# Altium project ezlo-thermostat.PrjPcb (part 3 of 3)

## Sheet ESP32-Sheet.SchDoc: =Projectname
size A4; SheetNumber: 8; SheetTotal: 9
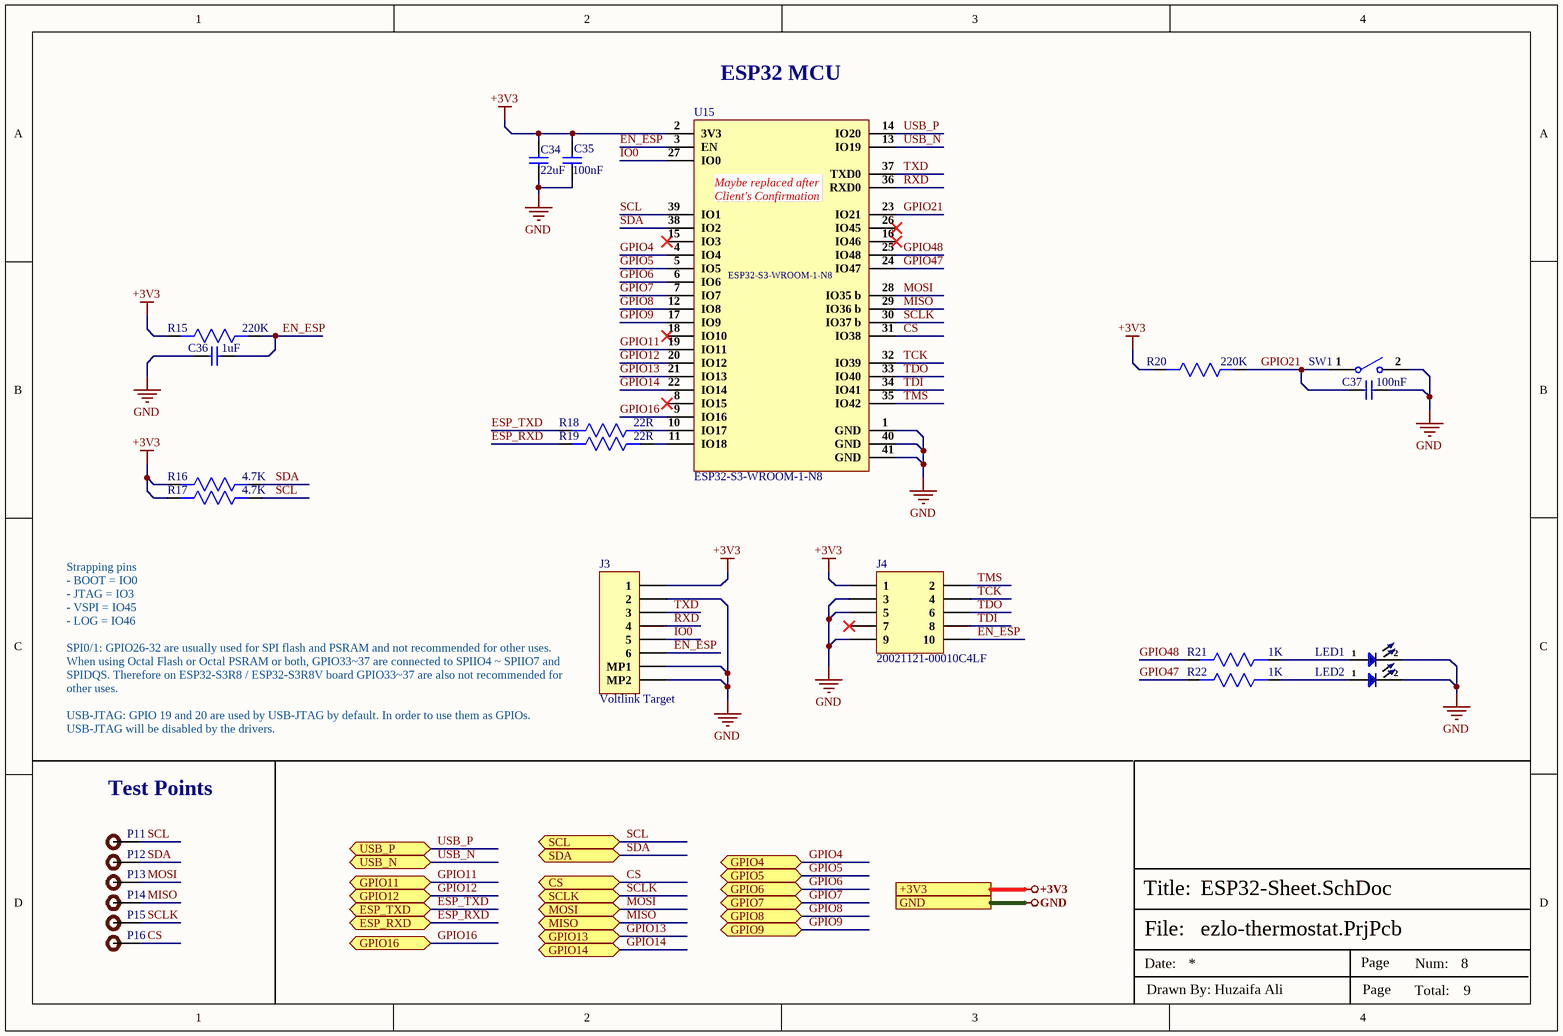
[diagram p7: ESP32-Sheet.SchDoc]

### Parts
C34  22uF  [Cap-0603]
C35  100nF  [Cap-0402]
C36  1uF  [Cap-0402]
C37  100nF  [Cap-0402]
J3  Voltlink Target  [Voltlink Target]
J4  20021121-00010C4LF  [20021121-00010C4LF_]
LED1  Transparent  [LED-0603]  (value not drawn)
LED2  Yellow  [LED-0603]  (value not drawn)
P11  TEST POINT  [Test-point]  (value not drawn)
P12  TEST POINT  [Test-point]  (value not drawn)
P13  TEST POINT  [Test-point]  (value not drawn)
P14  TEST POINT  [Test-point]  (value not drawn)
P15  TEST POINT  [Test-point]  (value not drawn)
P16  TEST POINT  [Test-point]  (value not drawn)
R15  220K  [Res-0402]
R16  4.7K  [Res-0402]
R17  4.7K  [Res-0402]
R18  22R  [Res-0402]
R19  22R  [Res-0402]
R20  220K  [Res-0402]
R21  1K  [Res-0402]
R22  1K  [Res-0402]
SW1  YTS-B003-2A  [YTS-B003-2A]  (value not drawn)
U15  ESP32-S3-WROOM-1-N8  [41-SMD Module]

### Ports
+3V3, CS (bidir), ESP_RXD (bidir), ESP_TXD (bidir), GND, GPIO4 (bidir), GPIO5 (bidir), GPIO6 (bidir), GPIO7 (bidir), GPIO8 (bidir), GPIO9 (bidir), GPIO11 (bidir), GPIO12 (bidir), GPIO13 (bidir), GPIO14 (bidir), GPIO16 (bidir), MISO (bidir), MOSI (bidir), SCL (bidir), SCLK (bidir), SDA (bidir), USB_N (bidir), USB_P (bidir)

### Nets
+3V3: C34.1 C35.1 J3.1 J4.1 R15.2 R16.2 R17.2 R20.2 U15.2(3V3) ; port +3V3
GND: C34.2 C35.2 C36.1 C37.2 J3.2 J3.MP1 J3.MP2 J4.3 J4.5 J4.9 LED1.2 LED2.2 SW1.2(NO) U15.1(GND) U15.40(GND) U15.41(GND) ; port GND
CS: P16.1 U15.31(IO38) ; port CS  [project net B1]
EN_ESP: C36.2 J3.6 J4.10 R15.1 U15.3(EN)
ESP_RXD: R19.2 ; port ESP_RXD
ESP_TXD: R18.2 ; port ESP_TXD
GPIO4: U15.4(IO4) ; port GPIO4
GPIO5: U15.5(IO5) ; port GPIO5
GPIO6: U15.6(IO6) ; port GPIO6
GPIO7: U15.7(IO7) ; port GPIO7
GPIO8: U15.12(IO8) ; port GPIO8
GPIO9: U15.17(IO9) ; port GPIO9
GPIO11: U15.19(IO11) ; port GPIO11
GPIO12: U15.20(IO12) ; port GPIO12
GPIO13: U15.21(IO13) ; port GPIO13  [project net B5]
GPIO14: U15.22(IO14) ; port GPIO14  [project net B6]
GPIO16: U15.9(IO16) ; port GPIO16
GPIO21: C37.1 R20.1 SW1.1(COMMON) U15.23(IO21)
GPIO47: R22.2 U15.24(IO47)
GPIO48: R21.2 U15.25(IO48)
IO0: J3.5 U15.27(IO0)
MISO: P14.1 U15.29(IO36_b) ; port MISO  [project net B4]
MOSI: P13.1 U15.28(IO35_b) ; port MOSI  [project net B3]
RXD: J3.4 U15.36(RXD0)
SCL: P11.1 R17.1 U15.39(IO1) ; port SCL
SCLK: P15.1 U15.30(IO37_b) ; port SCLK  [project net B2]
SDA: P12.1 R16.1 U15.38(IO2) ; port SDA
TCK: J4.4 U15.32(IO39)
TDI: J4.8 U15.34(IO41)
TDO: J4.6 U15.33(IO40)
TMS: J4.2 U15.35(IO42)
TXD: J3.3 U15.37(TXD0)
USB_N: U15.13(IO19) ; port USB_N
USB_P: U15.14(IO20) ; port USB_P
NetLED1_1: LED1.1 R21.1
NetLED2_1: LED2.1 R22.1
NetR18_1: R18.1 U15.10(IO17)
NetR19_1: R19.1 U15.11(IO18)

Not connected (* = marked no-connect by the designer): J4 7*; U15 8(IO15)* 15(IO3)* 16(IO46)* 18(IO10)* 26(IO45)*

### Notes on the sheet
- (near U15) ESP32 MCU
- (near U15) Maybe replaced after Client's Confirmation
- Strapping pins
  - BOOT = IO0
  - JTAG = IO3
  - VSPI = IO45
  - LOG = IO46
  SPI0/1: GPIO26-32 are usually used for SPI flash and PSRAM and not recommended for other uses.
  When using Octal Flash or Octal PSRAM or both, GPIO33~37 are connected to SPIIO4 ~ SPIIO7 and SPIDQS. Therefore on ESP32-S3R8 / ESP32-S3R8V board GPIO33~37 are also not recommended for other uses.
  USB-JTAG: GPIO 19 and 20 are used by USB-JTAG by default. In order to use them as GPIOs. USB-JTAG will be disabled by the drivers.
- Test Points
- File:
- Title:
- Date:
- Page
- Num:
- Total:
- Drawn By: Huzaifa Ali

### Library data of the parts
C34 = CC0603MRX5R5BB226: CAP CER 22UF 6.3V X5R 0603; Manufacturer: Yageo; Tolerance: 20%; Supplier 1: Mouser; Manufacturer Part Number: CC0603MRX5R5BB226; RoHS: Yes; Category: Ceramic Capacitors; Stock 1: 3030; Pricing 1: 1=0.33000, 10=0.22500, 50=0.22500, 100=0.12800, 1000=0.07900, 10000=0.06500 (USD); Mount: Surface Mount; Case/Package: 0603; Case Code (Metric): 1608; Case Code (Imperial): 0603; Weight: 7.1E-05oz; Min Operating Temperature: -55°C; Max Operating Temperature: 85°C; Capacitance: 22uF; Packaging: Tape and Reel; Dielectric: X5R; Voltage Rating: 6.3V; Termination: SMD/SMT; Resistor Type: Ceramic; Voltage Rating (DC): 6.3V; Package Quantity: 4000; Length: 0.063inch; Width: 0.031inch; Thickness: 0.035inch; Depth: 0.8mm; Lead Free: Lead Free; Halogen Free: Halogen Free; RoHS Compliant: Yes; ComponentLink1URL: http://www.mouser.com/ds/2/447/Yageo_UPY-GP_NP0_16V-to-50V_9-358835.pdf?src-supplier=Mouser; ComponentLink1Description: http://www.mouser.com/ds/2/447/Yageo_UPY-GP_NP0_16V-to-50V_9-358835.pdf?src-supplier=Mouser; ComponentLink2URL: http://www.yageo.com/documents/recent/UPY-GPHC_X5R_4V-to-50V_25.pdf?src-supplier=Digi-Key; ComponentLink2Description: http://www.yageo.com/documents/recent/UPY-GPHC_X5R_4V-to-50V_25.pdf?src-supplier=Digi-Key; Supplier Part Number 1: 603-CC603MRX5R5BB226; LCSC Part Number: C109448
C35 C37 = CC0402KRX5R8BB104: CAP CER 0.1UF 25V X5R 0402; Manufacturer: Yageo; Tolerance: 10%; Item Type: Capacitor; Supplier 1: Digi-Key; Manufacturer Part Number: CC0402KRX5R8BB104; RoHS: Yes; Category: Ceramic Capacitors; Stock 1: 4598218; Pricing 1: 1=0.10000, 10=0.03800, 50=0.02100, 100=0.01710, 500=0.01224, 1000=0.00961, 2500=0.00874, 5000=0.00804 (USD); Mount: Surface Mount; Case/Package: 0402; Case Code (Metric): 1005; Case Code (Imperial): 0402; Min Operating Temperature: -55°C; Max Operating Temperature: 85°C; Voltage Rating: 25V; Packaging: Tape and Reel; Capacitance: 100nF; Voltage Rating (DC): 25V; Dielectric: X5R; Resistor Type: Ceramic; Series: CC; Length: 0.039inch; Width: 0.02inch; Thickness: 0.022inch; Depth: 0.5mm; Lead Free: Lead Free; Halogen Free: Halogen Free; RoHS Compliant: Yes; ComponentLink1URL: http://www.mouser.com/ds/2/447/UPY-GPHC_X5R_4V-to-50V_25-1131599.pdf?src-supplier=Mouser; ComponentLink1Description: http://www.mouser.com/ds/2/447/UPY-GPHC_X5R_4V-to-50V_25-1131599.pdf?src-supplier=Mouser; ComponentLink2URL: http://www.yageo.com/documents/recent/UPY-GPHC_X5R_4V-to-50V-16.pdf?src-supplier=Future+Electronics; ComponentLink2Description: http://www.yageo.com/documents/recent/UPY-GPHC_X5R_4V-to-50V-16.pdf?src-supplier=Future+Electronics; ComponentLink3URL: http://www.yageo.com/documents/recent/UPY-GPHC_X5R_4V-to-50V_25.pdf?src-supplier=Digi-Key; ComponentLink3Description: http://www.yageo.com/documents/recent/UPY-GPHC_X5R_4V-to-50V_25.pdf?src-supplier=Digi-Key; Supplier Part Number 1: 311-1697-1-ND; LCSC Part Number: C106256
C36 = CC0402KRX5R8BB105: CAP CER 1UF 25V X5R 0402; Manufacturer: Yageo; Tolerance: 10%; Supplier 1: Mouser; Manufacturer Part Number: CC0402KRX5R8BB105; RoHS: Yes; Category: Ceramic Capacitors; Stock 1: 91975; Pricing 1: 1=0.30000, 10=0.20400, 50=0.20400, 100=0.11600, 1000=0.07200, 10000=0.05900 (USD); Mount: Surface Mount; Case/Package: 0402; Case Code (Metric): 1005; Case Code (Imperial): 0402; Weight: 2.3E-05oz; Min Operating Temperature: -55°C; Max Operating Temperature: 85°C; Packaging: Tape and Reel; Capacitance: 1uF; Voltage Rating: 25V; Dielectric: X5R; Termination: SMD/SMT; Voltage Rating (DC): 25V; Package Quantity: 10000; Length: 0.039inch; Width: 0.02inch; Thickness: 0.022inch; Lead Free: Lead Free; Halogen Free: Halogen Free; RoHS Compliant: Yes; ComponentLink1URL: http://www.mouser.com/ds/2/447/Yageo_UPY-GP_NP0_16V-to-50V_9-358835.pdf?src-supplier=Mouser; ComponentLink1Description: http://www.mouser.com/ds/2/447/Yageo_UPY-GP_NP0_16V-to-50V_9-358835.pdf?src-supplier=Mouser; ComponentLink2URL: http://www.yageo.com/documents/recent/UPY-GPHC_X5R_4V-to-50V_25.pdf?src-supplier=Digi-Key; ComponentLink2Description: http://www.yageo.com/documents/recent/UPY-GPHC_X5R_4V-to-50V_25.pdf?src-supplier=Digi-Key; ComponentLink3URL: https://4donline.ihs.com/images/VipMasterIC/IC/YAGO/YAGO-S-A0006851646/YAGO-S-A0006851646-1.pdf?hkey=6D3A4C79FDBF58556ACFDE234799DDF0&src-supplier=Newark; ComponentLink3Description: https://4donline.ihs.com/images/VipMasterIC/IC/YAGO/YAGO-S-A0006851646/YAGO-S-A0006851646-1.pdf?hkey=6D3A4C79FDBF58556ACFDE234799DDF0&src-supplier=Newark; Supplier Part Number 1: 603-CC402KRX5R8BB105; LCSC Part Number: C326568
J3 = C145963: 1x6P SH 1 1mm 6 SMD,P=1mm Wire To Board / Wire To Wire Connector ROHS; Manufacturer: BOOMELE; Manufacturer Part Number: C145963; Package: SMD,P=1mm; LCSC Part Number: C145963; Item Type: Connector; ComponentLink1Description: LCSC; ComponentLink1URL: https://www.lcsc.com/product-detail/Wire-To-Board-Wire-To-Wire-Connector_BOOMELE-Boom-Precision-Elec-C145963_C145963.html
J4 = 20021121-00010C4LF: CONN HEADER SMD 10POS 1.27MM; Manufacturer: Amphenol FCI; Number of Contacts: 10; Contact Resistance: 30mR; Current Rating: 1A; Voltage Rating: 125V; Insulation Resistance: 100MR; Gender: Male; Connector Type: Male Pin,Header; Row Spacing: 0.05inch; Stack Height: 3mm; Item Type: Jtag Header; Supplier 1: Digi-Key; Manufacturer Part Number: 20021121-00010C4LF; Stock 1: 0; Pricing 1: 1=0.87, 10=0.761, 100=0.6563 (USD); Mount: Surface Mount; Contact Plating: Gold; Contact Material: Copper Alloy,Copper,Gold; Color: Black; Housing Color: Black; Housing Material: Thermoplastic; Min Operating Temperature: -40°C; Max Operating Temperature: 85°C; Number of Rows: 2; Termination: Solder; Packaging: Tape and Reel; Package Quantity: 600; Number of Positions: 10; Max Voltage Rating (AC): 125V; Orientation: Straight; Length: 6.35mm; Pitch: 1.27mm; Contact Mating Length: 0.12inch; Depth: 3.4mm; Radiation Hardening: No; REACH SVHC: No SVHC; ComponentLink1URL: https://www.verical.com/server-webapp/html/getDatasheet?partID=177140&src-supplier=Verical; ComponentLink1Description: https://www.verical.com/server-webapp/html/getDatasheet?partID=177140&src-supplier=Verical; ComponentLink2URL: http://portal.fciconnect.com/Comergent/fci/drawing/20021121.pdf?src-supplier=Avnet; ComponentLink2Description: http://portal.fciconnect.com/Comergent/fci/drawing/20021121.pdf?src-supplier=Avnet; ComponentLink3URL: https://cdn.amphenol-icc.com/media/wysiwyg/files/drawing/20021121.pdf?src-supplier=Digi-Key; ComponentLink3Description: https://cdn.amphenol-icc.com/media/wysiwyg/files/drawing/20021121.pdf?src-supplier=Digi-Key; ComponentLink4URL: http://portal.fciconnect.com/Comergent/fci/drawing/20021121.pdf?src-supplier=Avnet+Europe; ComponentLink4Description: http://portal.fciconnect.com/Comergent/fci/drawing/20021121.pdf?src-supplier=Avnet+Europe; ComponentLink5URL: https://media.digikey.com/pdf/Data%20Sheets/FCI%20PDFs/Minitek%20127_Catalog.pdf?src-supplier=Digi-Key; ComponentLink5Description: https://media.digikey.com/pdf/Data%20Sheets/FCI%20PDFs/Minitek%20127_Catalog.pdf?src-supplier=Digi-Key; ComponentLink6URL: http://portal.fciconnect.com/Comergent//fci/drawing/20021121.pdf?src-supplier=Mouser; ComponentLink6Description: http://portal.fciconnect.com/Comergent//fci/drawing/20021121.pdf?src-supplier=Mouser; Supplier Part Number 1: 609-3695-6-ND; LCSC Part Number: C150517
LED1 = 19-21/R7C-AK1L2BY/3T: Red 632nm LED Indication - Discrete 2.05V 0603 (1608 Metric); Manufacturer: Everlight Elec; Manufacturer Part Number: 19-21/R7C-AK1L2BY/3T; Package: 0603; LCSC Part Number: C1322287; Item Type: LED; ComponentLink1Description: LCSC; ComponentLink1URL: https://www.lcsc.com/product-detail/Light-Emitting-Diodes-LED_Everlight-Elec-19-21-R7C-AK1L2BY-3T_C1322287.html
LED2 = 19-21/G6C-FM1N2B/3T: Yellow-Green 572nm LED Indication - Discrete 2.05V 0603 (1608 Metric); Manufacturer: Everlight Elec; Manufacturer Part Number: 19-21/G6C-FM1N2B/3T; Package: 0603; LCSC Part Number: C93689; Item Type: LED; ComponentLink1Description: LCSC; ComponentLink1URL: https://www.lcsc.com/product-detail/Light-Emitting-Diodes-LED_Everlight-Elec-19-21-G6C-FM1N2B-3T_C93689.html
P11-P16 = TEST POINT: Test Point ON
R15 R20 = RC0402FR-07220KL: RES 220K OHM 1% 1/16W 0402; Manufacturer: Yageo; Resistance: 220kR; Power Rating: 62.5mW; Voltage Rating: 50V; Temperature Coefficient: 100ppm/°C; Max Power Dissipation: 63mW; Supplier 1: Digi-Key; Manufacturer Part Number: RC0402FR-07220KL; RoHS: Yes; Category: Chip SMD Resistors; Stock 1: 1192792; Pricing 1: 1=0.10000, 10=0.01400, 100=0.00580, 1000=0.00262, 2500=0.00228, 5000=0.00188 (USD); Case/Package: 0402; Case Code (Imperial): 0402; Case Code (Metric): 1005; Weight: 2.3E-05oz; Size Code: 0402; Min Operating Temperature: -55°C; Max Operating Temperature: 155°C; Tolerance: 1%; Package Quantity: 1; Packaging: Tape and Reel; Termination: SMD/SMT; Resistor Type: Thick Film; Number of Terminations: 2; Features: Moisture Resistant; Series: RC; Resistance Tolerance: 1%; Technology: THICK FILM; Construction: Rectangular; Length: 1mm; Width: 0.02inch; Height: 0.016inch; Depth: 0.5mm; RoHS Compliant: Yes; Reach SVHC Compliant: Yes; Military Standard: Not; Lead Free: Lead Free; ComponentLink1URL: https://datasheet.ciiva.com/11808/0900766b80c66297-11808792.pdf?src-supplier=RSComponents; ComponentLink1Description: https://datasheet.ciiva.com/11808/0900766b80c66297-11808792.pdf?src-supplier=RSComponents; ComponentLink2URL: https://datasheet.ciiva.com/5924/1018594-5924944.pdf?src-supplier=Farnell; ComponentLink2Description: https://datasheet.ciiva.com/5924/1018594-5924944.pdf?src-supplier=Farnell; ComponentLink3URL: https://datasheet.ciiva.com/2453/pyu-r-int-thick-7-2453533.pdf?src-supplier=Digi-Key; ComponentLink3Description: https://datasheet.ciiva.com/2453/pyu-r-int-thick-7-2453533.pdf?src-supplier=Digi-Key; ComponentLink4URL: https://datasheet.ciiva.com/2453/pyu-r-int-thick-7-2453534.pdf?src-supplier=Digi-Key; ComponentLink4Description: https://datasheet.ciiva.com/2453/pyu-r-int-thick-7-2453534.pdf?src-supplier=Digi-Key; ComponentLink5URL: https://datasheet.ciiva.com/2453/pyu-r-int-thick-7-2453532.pdf?src-supplier=Digi-Key; ComponentLink5Description: https://datasheet.ciiva.com/2453/pyu-r-int-thick-7-2453532.pdf?src-supplier=Digi-Key; ComponentLink6URL: https://datasheet.ciiva.com/12577/pyu-rc0402-51-rohs-l-6-r-12577270.pdf?src-supplier=Mouser; ComponentLink6Description: https://datasheet.ciiva.com/12577/pyu-rc0402-51-rohs-l-6-r-12577270.pdf?src-supplier=Mouser; Supplier Part Number 1: 311-220KLRCT-ND
R16 R17 = RC0402FR-074K7L: RES 4.7K OHM 1% 1/16W 0402; Manufacturer: Yageo; Voltage Rating (DC): 50V; Power Rating: 62.5mW; Resistance: 4.7kR; Temperature Coefficient: 100ppm/°C; Max Power Dissipation: 63mW; Item Type: Resistor; Supplier 1: Avnet; Manufacturer Part Number: RC0402FR-074K7L; RoHS: Yes; Category: Chip SMD Resistors; Stock 1: 2420000; Pricing 1: 10000=0.00085 (USD); Case/Package: 0402; Number of Pins: 2; Case Code (Imperial): 0402; Case Code (Metric): 1005; Size Code: 0402; Min Operating Temperature: -55°C; Max Operating Temperature: 155°C; Tolerance: 1%; Voltage Rating: 50V; Packaging: Tape and Reel; Resistor Type: Thick Film; Termination: SMD/SMT; Features: Moisture Resistant; Series: RC; Number of Terminations: 2; Resistance Tolerance: 1%; Construction: Rectangular; Length: 1mm; Width: 0.5mm; Height: 0.32mm; Depth: 0.5mm; Height - Seated (Max): 0.016inch; RoHS Compliant: Yes; Reach SVHC Compliant: Yes; Military Standard: Not; Lead Free: Lead Free; ComponentLink1URL: https://datasheet.ciiva.com/22661/1686128-22661342.pdf?src-supplier=Element14; ComponentLink1Description: https://datasheet.ciiva.com/22661/1686128-22661342.pdf?src-supplier=Element14; ComponentLink2URL: https://datasheet.ciiva.com/7850/1018594-7850022.pdf?src-supplier=Element14; ComponentLink2Description: https://datasheet.ciiva.com/7850/1018594-7850022.pdf?src-supplier=Element14; ComponentLink3URL: https://datasheet.ciiva.com/7850/1018594-7850023.pdf?src-supplier=Element14; ComponentLink3Description: https://datasheet.ciiva.com/7850/1018594-7850023.pdf?src-supplier=Element14; ComponentLink4URL: https://datasheet.ciiva.com/15215/getdatasheetpartid-328119-15215035.pdf?src-supplier=Verical; ComponentLink4Description: https://datasheet.ciiva.com/15215/getdatasheetpartid-328119-15215035.pdf?src-supplier=Verical; Supplier Part Number 1: RC0402FR-074K7L; LCSC Part Number: C105871
R18 R19 = RC0402FR-0722RL: RES 22 OHM 1% 1/16W 0402; Manufacturer: Yageo; Voltage Rating: 50V; Power Rating: 62.5mW; Temperature Coefficient: 100ppm/°C; Max Power Dissipation: 63mW; Item Type: Resistor; Supplier 1: Avnet; Manufacturer Part Number: RC0402FR-0722RL; RoHS: Yes; Category: Chip SMD Resistors; Stock 1: 1810000; Pricing 1: 10000=0.00085 (USD); Case/Package: 0402; Number of Pins: 2; Case Code (Imperial): 0402; Case Code (Metric): 1005; Size Code: 0402; Min Operating Temperature: -55°C; Max Operating Temperature: 155°C; Resistor Type: Thick Film; Voltage Rating (DC): 50V; Resistance: 22R; Tolerance: 1%; Packaging: Tape and Reel; Termination: SMD/SMT; Features: Moisture Resistant; Series: RC; Number of Terminations: 2; Resistance Tolerance: 1%; Technology: THICK FILM; Construction: Rectangular; Length: 1mm; Width: 0.5mm; Height: 0.32mm; Depth: 0.5mm; RoHS Compliant: Yes; Reach SVHC Compliant: Yes; Military Standard: Not; Lead Free: Lead Free; ComponentLink1URL: https://datasheet.ciiva.com/11819/0900766b80c66297-11819462.pdf?src-supplier=RSComponents; ComponentLink1Description: https://datasheet.ciiva.com/11819/0900766b80c66297-11819462.pdf?src-supplier=RSComponents; ComponentLink2URL: https://datasheet.ciiva.com/7849/1018594-7849912.pdf?src-supplier=Element14; ComponentLink2Description: https://datasheet.ciiva.com/7849/1018594-7849912.pdf?src-supplier=Element14; ComponentLink3URL: https://datasheet.ciiva.com/7849/1018594-7849911.pdf?src-supplier=Element14; ComponentLink3Description: https://datasheet.ciiva.com/7849/1018594-7849911.pdf?src-supplier=Element14; ComponentLink4URL: https://datasheet.ciiva.com/16930/pyu-rc0402-51-rohs-l-6-r-16930687.pdf?src-supplier=Future+Electronics; ComponentLink4Description: https://datasheet.ciiva.com/16930/pyu-rc0402-51-rohs-l-6-r-16930687.pdf?src-supplier=Future+Electronics; ComponentLink5URL: https://datasheet.ciiva.com/26829/getdatasheetpartid-554995-26829991.pdf?src-supplier=Verical; ComponentLink5Description: https://datasheet.ciiva.com/26829/getdatasheetpartid-554995-26829991.pdf?src-supplier=Verical; Supplier Part Number 1: RC0402FR-0722RL; LCSC Part Number: C114765
R21 R22 = RC0402FR-071KL: RES 1K OHM 1% 1/16W 0402; Manufacturer: Yageo; Resistance: 1kR; Temperature Coefficient: 100ppm/°C; Voltage Rating (DC): 50V; Power Rating: 62.5mW; Max Power Dissipation: 63mW; Item Type: Resistor; Supplier 1: Avnet; Manufacturer Part Number: RC0402FR-071KL; RoHS: Yes; Category: Chip SMD Resistors; Stock 1: 13030000; Pricing 1: 10000=0.00085, 20000=0.00087, 40000=0.00084, 60000=0.00083, 80000=0.00079, 100000=0.00078, 1000000=0.00076 (USD); Case/Package: 0402; Number of Pins: 2; Case Code (Imperial): 0402; Case Code (Metric): 1005; Size Code: 0402; Min Operating Temperature: -55°C; Max Operating Temperature: 155°C; Resistor Type: Thick Film; Tolerance: 1%; Packaging: Tape and Reel; Voltage Rating: 50V; Termination: SMD/SMT; Features: Moisture Resistant; Series: RC; Number of Terminations: 2; Resistance Tolerance: 1%; Construction: Rectangular; Technology: THICK FILM; Length: 1mm; Width: 0.5mm; Height: 0.32mm; Depth: 0.5mm; Reach SVHC Compliant: Yes; Lead Free: Lead Free; RoHS Compliant: Yes; Military Standard: Not; ComponentLink1URL: https://datasheet.ciiva.com/11819/0900766b80c66297-11819477.pdf?src-supplier=RSComponents; ComponentLink1Description: https://datasheet.ciiva.com/11819/0900766b80c66297-11819477.pdf?src-supplier=RSComponents; ComponentLink2URL: https://datasheet.ciiva.com/7983/1018594-7983502.pdf?src-supplier=Element14; ComponentLink2Description: https://datasheet.ciiva.com/7983/1018594-7983502.pdf?src-supplier=Element14; ComponentLink3URL: https://datasheet.ciiva.com/22747/1018594-22747513.pdf?src-supplier=Element14; ComponentLink3Description: https://datasheet.ciiva.com/22747/1018594-22747513.pdf?src-supplier=Element14; ComponentLink4URL: https://datasheet.ciiva.com/12666/pyu-rc0402-51-rohs-l-6-r-12666741.pdf?src-supplier=Mouser; ComponentLink4Description: https://datasheet.ciiva.com/12666/pyu-rc0402-51-rohs-l-6-r-12666741.pdf?src-supplier=Mouser; ComponentLink5URL: https://datasheet.ciiva.com/7849/1018594-7849869.pdf?src-supplier=Element14; ComponentLink5Description: https://datasheet.ciiva.com/7849/1018594-7849869.pdf?src-supplier=Element14; ComponentLink6URL: https://datasheet.ciiva.com/7849/1018594-7849871.pdf?src-supplier=Element14; ComponentLink6Description: https://datasheet.ciiva.com/7849/1018594-7849871.pdf?src-supplier=Element14; ComponentLink7URL: https://datasheet.ciiva.com/17063/pyu-rc0402-51-rohs-l-6-r-17063193.pdf?src-supplier=Future+Electronics; ComponentLink7Description: https://datasheet.ciiva.com/17063/pyu-rc0402-51-rohs-l-6-r-17063193.pdf?src-supplier=Future+Electronics; Supplier Part Number 1: RC0402FR-071KL; LCSC Part Number: C106235
SW1 = YTS-B003-2A: 3.5mm 3.5mm SMDSplicing Black Rectangle button 50mA Surface Mount 7mm SPST 100MΩ 20000 12V 250gf@±50gf SMD Tactile Switches ROHS; Manufacturer: YIYUAN; Manufacturer Part Number: YTS-B003-2A; Package: Custom; LCSC Part Number: C2910695; ComponentLink1Description: LCSC; ComponentLink1URL: https://lcsc.com/product-detail/Tactile-Switches_YIYUAN-YTS-B003-2A_C2910695.html; Item Type: Tactile Switch
U15 = ESP32-S3-WROOM-1-N8: SMD MODULE, ESP32-S3, 8 MB SPI F; Manufacturer: Espressif Systems; Supplier 1: Digi-Key; Manufacturer Part Number: ESP32-S3-WROOM-1-N8; RoHS: No; Category: Uncategorized; Stock 1: 7933; Pricing 1: 1=3.52000 (USD); Supplier Part Number 1: 1965-ESP32-S3-WROOM-1-N8CT-ND; LCSC Part Number: C2913198; Item Type: Module; ComponentLink1Description: LCSC; ComponentLink1URL: https://www.lcsc.com/product-detail/WiFi-Modules_Espressif-Systems-ESP32-S3-WROOM-1-N8_C2913198.html

## Sheet Miscellaneous-Sheet.SchDoc
size A4; SheetNumber: 9; SheetTotal: 9
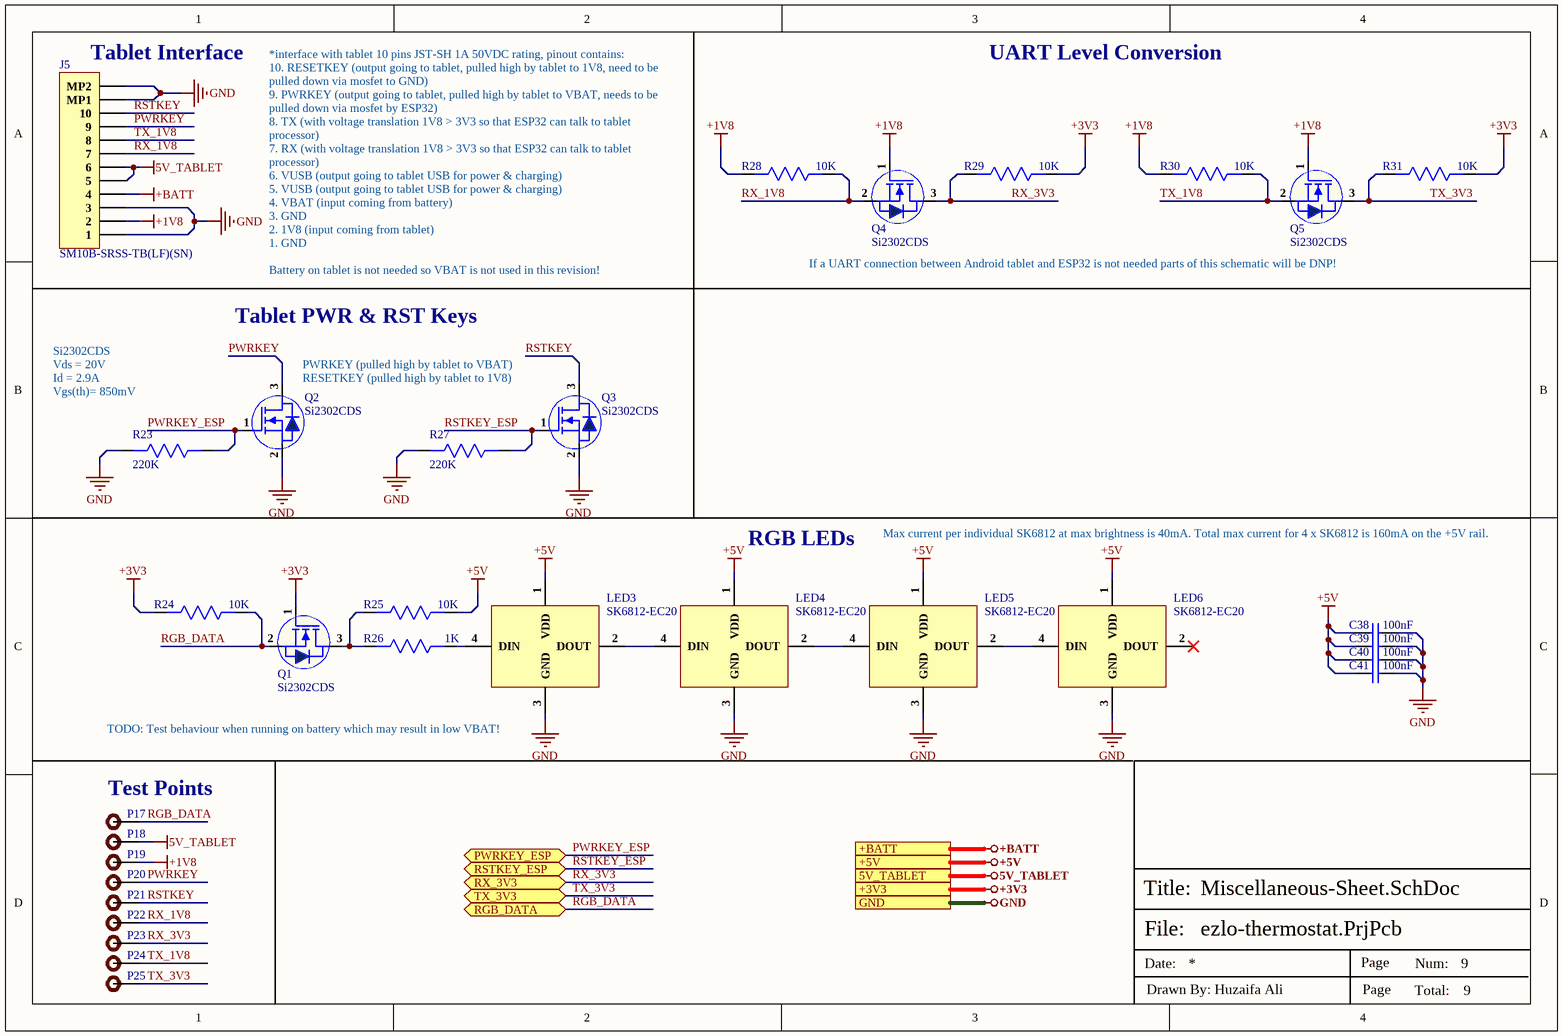
[diagram p8: Miscellaneous-Sheet.SchDoc]

### Parts
C38  100nF  [Cap-0402]
C39  100nF  [Cap-0402]
C40  100nF  [Cap-0402]
C41  100nF  [Cap-0402]
J5  SM10B-SRSS-TB(LF)(SN)  [SM10B-SRSS-TB(LF)(SN)]
LED3  SK6812-EC20  [SK6812-EC20]
LED4  SK6812-EC20  [SK6812-EC20]
LED5  SK6812-EC20  [SK6812-EC20]
LED6  SK6812-EC20  [SK6812-EC20]
P17  TEST POINT  [Test-point]  (value not drawn)
P18  TEST POINT  [Test-point]  (value not drawn)
P19  TEST POINT  [Test-point]  (value not drawn)
P20  TEST POINT  [Test-point]  (value not drawn)
P21  TEST POINT  [Test-point]  (value not drawn)
P22  TEST POINT  [Test-point]  (value not drawn)
P23  TEST POINT  [Test-point]  (value not drawn)
P24  TEST POINT  [Test-point]  (value not drawn)
P25  TEST POINT  [Test-point]  (value not drawn)
Q1  Si2302CDS  [Sot-23]
Q2  Si2302CDS  [Sot-23]
Q3  Si2302CDS  [Sot-23]
Q4  Si2302CDS  [Sot-23]
Q5  Si2302CDS  [Sot-23]
R23  220K  [Res-0402]
R24  10K  [Res-0402]
R25  10K  [Res-0402]
R26  1K  [Res-0402]
R27  220K  [Res-0402]
R28  10K  [Res-0402]
R29  10K  [Res-0402]
R30  10K  [Res-0402]
R31  10K  [Res-0402]

### Ports
5V_TABLET, +3V3, +5V, +BATT, GND, PWRKEY_ESP (bidir), RGB_DATA (bidir), RSTKEY_ESP (bidir), RX_3V3 (bidir), TX_3V3 (bidir)

### Nets
5V_TABLET: J5.5 J5.6 P18.1 ; port 5V_TABLET
+1V8: J5.2 P19.1 Q4.1(G) Q5.1(G) R28.2 R30.2
+3V3: Q1.1(G) R24.2 R29.1 R31.1 ; port +3V3
+5V: C38.1 C39.1 C40.1 C41.1 LED3.1(VDD) LED4.1(VDD) LED5.1(VDD) LED6.1(VDD) R25.1 ; port +5V
+BATT: J5.4 ; port +BATT
GND: C38.2 C39.2 C40.2 C41.2 J5.1 J5.3 J5.MP1 J5.MP2 LED3.3(GND) LED4.3(GND) LED5.3(GND) LED6.3(GND) Q2.2(S) Q3.2(S) R23.2 R27.2 ; port GND
PWRKEY: J5.9 P20.1 Q2.3(D)
PWRKEY_ESP: Q2.1(G) R23.1 ; port PWRKEY_ESP  [project net GPIO11]
RGB_DATA: P17.1 Q1.2(S) R24.1 ; port RGB_DATA  [project net GPIO16]
RSTKEY: J5.10 P21.1 Q3.3(D)
RSTKEY_ESP: Q3.1(G) R27.1 ; port RSTKEY_ESP  [project net GPIO12]
RX_1V8: J5.7 P22.1 Q4.2(S) R28.1
RX_3V3: P23.1 Q4.3(D) R29.2 ; port RX_3V3  [project net ESP_TXD]
TX_1V8: J5.8 P24.1 Q5.2(S) R30.1
TX_3V3: P25.1 Q5.3(D) R31.2 ; port TX_3V3  [project net ESP_RXD]
NetLED3_2: LED3.2(DOUT) LED4.4(DIN)
NetLED3_4: LED3.4(DIN) R26.1
NetLED4_2: LED4.2(DOUT) LED5.4(DIN)
NetLED5_2: LED5.2(DOUT) LED6.4(DIN)
NetQ1_3: Q1.3(D) R25.2 R26.2

Not connected (* = marked no-connect by the designer): LED6 2(DOUT)*

### Notes on the sheet
- (near J5) Tablet Interface
- UART Level Conversion
- *interface with tablet 10 pins JST-SH 1A 50VDC rating, pinout contains:
  10. RESETKEY (output going to tablet, pulled high by tablet to 1V8, need to be pulled down via mosfet to GND)
  9. PWRKEY (output going to tablet, pulled high by tablet to VBAT, needs to be pulled down via mosfet by ESP32)
  8. TX (with voltage translation 1V8 > 3V3 so that ESP32 can talk to tablet processor)
  7. RX (with voltage translation 1V8 > 3V3 so that ESP32 can talk to tablet processor)
  6. VUSB (output going to tablet USB for power & charging)
  5. VUSB (output going to tablet USB for power & charging)
  4. VBAT (input coming from battery)
  3. GND
  2. 1V8 (input coming from tablet)
  1. GND
  Battery on tablet is not needed so VBAT is not used in this revision!
- Tablet PWR & RST Keys
- If a UART connection between Android tablet and ESP32 is not needed parts of this schematic will be DNP!
- PWRKEY (pulled high by tablet to VBAT)
  RESETKEY (pulled high by tablet to 1V8)
- (near R23) Si2302CDS
  Vds = 20V
  Id = 2.9A
  Vgs(th)= 850mV
- RGB LEDs
- Max current per individual SK6812 at max brightness is 40mA. Total max current for 4 x SK6812 is 160mA on the +5V rail.
- (near LED3) TODO: Test behaviour when running on battery which may result in low VBAT!
- (near P17) Test Points
- File:
- Title:
- Date:
- Page
- Num:
- Total:
- Drawn By: Huzaifa Ali

### Library data of the parts
C38-C41 = CC0402KRX5R8BB104: as C35 on sheet ESP32-Sheet; Supplier 1: Digi-Key; Manufacturer Part Number: CC0402KRX5R8BB104; RoHS: Yes; Category: Ceramic Capacitors; Stock 1: 4598218; Pricing 1: 1=0.10000, 10=0.03800, 50=0.02100, 100=0.01710, 500=0.01224, 1000=0.00961, 2500=0.00874, 5000=0.00804 (USD); Mount: Surface Mount; Case/Package: 0402; Case Code (Metric): 1005; Case Code (Imperial): 0402; Min Operating Temperature: -55°C; Max Operating Temperature: 85°C; Voltage Rating: 25V; Packaging: Tape and Reel; Capacitance: 100nF; Voltage Rating (DC): 25V; Dielectric: X5R; Resistor Type: Ceramic; Series: CC; Length: 0.039inch; Width: 0.02inch; Thickness: 0.022inch; Depth: 0.5mm; Lead Free: Lead Free; Halogen Free: Halogen Free; RoHS Compliant: Yes; ComponentLink1URL: http://www.mouser.com/ds/2/447/UPY-GPHC_X5R_4V-to-50V_25-1131599.pdf?src-supplier=Mouser; ComponentLink1Description: http://www.mouser.com/ds/2/447/UPY-GPHC_X5R_4V-to-50V_25-1131599.pdf?src-supplier=Mouser; ComponentLink2URL: http://www.yageo.com/documents/recent/UPY-GPHC_X5R_4V-to-50V-16.pdf?src-supplier=Future+Electronics; ComponentLink2Description: http://www.yageo.com/documents/recent/UPY-GPHC_X5R_4V-to-50V-16.pdf?src-supplier=Future+Electronics; ComponentLink3URL: http://www.yageo.com/documents/recent/UPY-GPHC_X5R_4V-to-50V_25.pdf?src-supplier=Digi-Key; ComponentLink3Description: http://www.yageo.com/documents/recent/UPY-GPHC_X5R_4V-to-50V_25.pdf?src-supplier=Digi-Key; Supplier Part Number 1: 311-1697-1-ND; LCSC Part Number: C106256
J5 = SM10B-SRSS-TB(LF)(SN): CONN HEADER SMD R/A 10POS 1MM; Manufacturer: JST; Contact Resistance: 40mR; Current Rating: 1A; Voltage Rating (AC): 50V; Gender: Male; Number of Positions: 10; Insulation Resistance: 100MR; Item Type: JST Connector; Supplier 1: Future Electronics; Manufacturer Part Number: SM10B-SRSS-TB(LF)(SN); RoHS: Yes; Category: Connectors; Pricing 1: 3000=0.64500 (USD); Mount: Surface Mount; Contact Plating: Tin,Lead,Copper; Contact Material: Copper Alloy; Color: Natural; Material: Polyamide; Housing Color: Beige; Housing Material: Polyamide; Contact Shape: Square; Contact Finish - Mating: TIN; Insulation Material: Nylon; Insulation Color: Natural; Min Operating Temperature: -25°C; Max Operating Temperature: 85°C; Number of Rows: 1; Packaging: Tape and Reel; Max Current Rating: 1A; Voltage Rating: 50V; Termination: Solder; Max Voltage Rating (AC): 50V; Number of Contacts: 10; Orientation: Right Angle; Connector Type: Header; Series: SR; Contact Type: Male Pin; Fastening Type: Pull; Length: 12mm; Lead Pitch: 1mm; Pitch: 1mm; Depth: 4.95mm; Reach SVHC Compliant: Yes; Lead Free: Lead Free; Flammability Rating: UL94 V-0; ComponentLink1URL: https://datasheet.ciiva.com/26894/getdatasheetpartid-708886-26894682.pdf?src-supplier=Verical; ComponentLink1Description: https://datasheet.ciiva.com/26894/getdatasheetpartid-708886-26894682.pdf?src-supplier=Verical; ComponentLink2URL: https://datasheet.ciiva.com/16221/sm10b-srss-tblfsn-16221242.pdf?src-supplier=Future+Electronics; ComponentLink2Description: https://datasheet.ciiva.com/16221/sm10b-srss-tblfsn-16221242.pdf?src-supplier=Future+Electronics; ComponentLink3URL: https://datasheet.ciiva.com/11752/0900766b8082f550-11752172.pdf?src-supplier=RSComponents; ComponentLink3Description: https://datasheet.ciiva.com/11752/0900766b8082f550-11752172.pdf?src-supplier=RSComponents; ComponentLink4URL: https://datasheet.ciiva.com/712/esr-712644.pdf?src-supplier=Digi-Key; ComponentLink4Description: https://datasheet.ciiva.com/712/esr-712644.pdf?src-supplier=Digi-Key; ComponentLink5URL: https://datasheet.ciiva.com/712/esr-712645.pdf?src-supplier=Digi-Key; ComponentLink5Description: https://datasheet.ciiva.com/712/esr-712645.pdf?src-supplier=Digi-Key; ComponentLink6URL: https://datasheet.ciiva.com/730/esr-730692.pdf?src-supplier=Digi-Key; ComponentLink6Description: https://datasheet.ciiva.com/730/esr-730692.pdf?src-supplier=Digi-Key; Supplier Part Number 1: 1165778; LCSC Part Number: C160409
LED3-LED6 = SK6812-EC20: 5mA -40℃~+80℃ RGB SMD,2x2mm Light Emitting Diodes (LED) ROHS; Manufacturer: OPSCO Optoelectronics; Item Type: RGB LED; Manufacturer Part Number: SK6812-EC20; Package: SMD,2x2mm; LCSC Part Number: C2909058; ComponentLink1Description: LCSC; ComponentLink1URL: https://www.lcsc.com/product-detail/Light-Emitting-Diodes-LED_OPSCO-Optoelectronics-SK6812-EC20_C2909058.html
P17-P25 = TEST POINT: Test Point ON
Q1-Q5 = Si2302CDS: N-CHANNEL 20-V (D-S) MOSFET; Manufacturer: TECH PUBLIC; ComponentLink1Description: LCSC; ComponentLink1URL: https://www.lcsc.com/product-detail/MOSFETs_TECH-PUBLIC-SI2302CDS_C5310968.html; Manufacturer Part Number: SI2302CDS; Package: SOT-23; LCSC Part Number: C5310968; Item Type: Mosfet
R23 R27 = RC0402FR-07220KL: as R15 on sheet ESP32-Sheet; Supplier 1: Digi-Key; Manufacturer Part Number: RC0402FR-07220KL; RoHS: Yes; Category: Chip SMD Resistors; Stock 1: 1192792; Pricing 1: 1=0.10000, 10=0.01400, 100=0.00580, 1000=0.00262, 2500=0.00228, 5000=0.00188 (USD); Case/Package: 0402; Case Code (Imperial): 0402; Case Code (Metric): 1005; Weight: 2.3E-05oz; Size Code: 0402; Min Operating Temperature: -55°C; Max Operating Temperature: 155°C; Tolerance: 1%; Package Quantity: 1; Packaging: Tape and Reel; Termination: SMD/SMT; Resistor Type: Thick Film; Number of Terminations: 2; Features: Moisture Resistant; Series: RC; Resistance Tolerance: 1%; Technology: THICK FILM; Construction: Rectangular; Length: 1mm; Width: 0.02inch; Height: 0.016inch; Depth: 0.5mm; RoHS Compliant: Yes; Reach SVHC Compliant: Yes; Military Standard: Not; Lead Free: Lead Free; ComponentLink1URL: https://datasheet.ciiva.com/11808/0900766b80c66297-11808792.pdf?src-supplier=RSComponents; ComponentLink1Description: https://datasheet.ciiva.com/11808/0900766b80c66297-11808792.pdf?src-supplier=RSComponents; ComponentLink2URL: https://datasheet.ciiva.com/5924/1018594-5924944.pdf?src-supplier=Farnell; ComponentLink2Description: https://datasheet.ciiva.com/5924/1018594-5924944.pdf?src-supplier=Farnell; ComponentLink3URL: https://datasheet.ciiva.com/2453/pyu-r-int-thick-7-2453533.pdf?src-supplier=Digi-Key; ComponentLink3Description: https://datasheet.ciiva.com/2453/pyu-r-int-thick-7-2453533.pdf?src-supplier=Digi-Key; ComponentLink4URL: https://datasheet.ciiva.com/2453/pyu-r-int-thick-7-2453534.pdf?src-supplier=Digi-Key; ComponentLink4Description: https://datasheet.ciiva.com/2453/pyu-r-int-thick-7-2453534.pdf?src-supplier=Digi-Key; ComponentLink5URL: https://datasheet.ciiva.com/2453/pyu-r-int-thick-7-2453532.pdf?src-supplier=Digi-Key; ComponentLink5Description: https://datasheet.ciiva.com/2453/pyu-r-int-thick-7-2453532.pdf?src-supplier=Digi-Key; ComponentLink6URL: https://datasheet.ciiva.com/12577/pyu-rc0402-51-rohs-l-6-r-12577270.pdf?src-supplier=Mouser; ComponentLink6Description: https://datasheet.ciiva.com/12577/pyu-rc0402-51-rohs-l-6-r-12577270.pdf?src-supplier=Mouser; Supplier Part Number 1: 311-220KLRCT-ND
R24 R25 R28-R31 = RC0402FR-0710KL: RES 10K OHM 1% 1/16W 0402; Manufacturer: Yageo; Resistance: 10kR; Voltage Rating (DC): 50V; Temperature Coefficient: 100ppm/°C; Power Rating: 62.5mW; Max Power Dissipation: 63mW; Supplier 1: Mouser; Manufacturer Part Number: RC0402FR-0710KL; RoHS: Yes; Category: Chip SMD Resistors; Stock 1: 18648329; Pricing 1: 1=0.10000, 10=0.01400, 50=0.01400, 100=0.00500, 1000=0.00300, 10000=0.00200 (USD); Case/Package: 0402; Number of Pins: 2; Case Code (Imperial): 0402; Case Code (Metric): 1005; Min Operating Temperature: -55°C; Max Operating Temperature: 155°C; Resistor Type: Thick Film; Tolerance: 1%; Packaging: Tape and Reel; Voltage Rating: 50V; Termination: SMD/SMT; Working Voltage: 50V; Number of Terminations: 2; Features: Moisture Resistant; Series: RC; Resistance Tolerance: 1%; Construction: Rectangular; Length: 1mm; Width: 0.5mm; Height: 0.32mm; Depth: 0.5mm; Lead Pitch: 0.2mm; REACH SVHC: No SVHC; Lead Free: Lead Free; RoHS Compliant: Yes; Military Standard: Not; ComponentLink1URL: https://datasheet.ciiva.com/7660/38568-7660787.pdf?src-supplier=Element14; ComponentLink1Description: https://datasheet.ciiva.com/7660/38568-7660787.pdf?src-supplier=Element14; ComponentLink2URL: https://datasheet.ciiva.com/7849/1686128-7849814.pdf?src-supplier=Element14; ComponentLink2Description: https://datasheet.ciiva.com/7849/1686128-7849814.pdf?src-supplier=Element14; ComponentLink3URL: https://datasheet.ciiva.com/7983/1018594-7983486.pdf?src-supplier=Element14; ComponentLink3Description: https://datasheet.ciiva.com/7983/1018594-7983486.pdf?src-supplier=Element14; ComponentLink4URL: https://datasheet.ciiva.com/22747/1018594-22747512.pdf?src-supplier=Element14; ComponentLink4Description: https://datasheet.ciiva.com/22747/1018594-22747512.pdf?src-supplier=Element14; ComponentLink5URL: https://datasheet.ciiva.com/12667/pyu-rc0402-51-rohs-l-6-r-12667067.pdf?src-supplier=Mouser; ComponentLink5Description: https://datasheet.ciiva.com/12667/pyu-rc0402-51-rohs-l-6-r-12667067.pdf?src-supplier=Mouser; ComponentLink6URL: https://datasheet.ciiva.com/7849/1784430-7849813.pdf?src-supplier=Element14; ComponentLink6Description: https://datasheet.ciiva.com/7849/1784430-7849813.pdf?src-supplier=Element14; ComponentLink7URL: https://datasheet.ciiva.com/7849/1784430-7849815.pdf?src-supplier=Element14; ComponentLink7Description: https://datasheet.ciiva.com/7849/1784430-7849815.pdf?src-supplier=Element14; Supplier Part Number 1: 603-RC0402FR-0710KL; LCSC Part Number: C60490
R26 = RC0402FR-071KL: as R21 on sheet ESP32-Sheet; Supplier 1: Avnet; Manufacturer Part Number: RC0402FR-071KL; RoHS: Yes; Category: Chip SMD Resistors; Stock 1: 13030000; Pricing 1: 10000=0.00085, 20000=0.00087, 40000=0.00084, 60000=0.00083, 80000=0.00079, 100000=0.00078, 1000000=0.00076 (USD); Case/Package: 0402; Number of Pins: 2; Case Code (Imperial): 0402; Case Code (Metric): 1005; Size Code: 0402; Min Operating Temperature: -55°C; Max Operating Temperature: 155°C; Resistor Type: Thick Film; Tolerance: 1%; Packaging: Tape and Reel; Voltage Rating: 50V; Termination: SMD/SMT; Features: Moisture Resistant; Series: RC; Number of Terminations: 2; Resistance Tolerance: 1%; Construction: Rectangular; Technology: THICK FILM; Length: 1mm; Width: 0.5mm; Height: 0.32mm; Depth: 0.5mm; Reach SVHC Compliant: Yes; Lead Free: Lead Free; RoHS Compliant: Yes; Military Standard: Not; ComponentLink1URL: https://datasheet.ciiva.com/11819/0900766b80c66297-11819477.pdf?src-supplier=RSComponents; ComponentLink1Description: https://datasheet.ciiva.com/11819/0900766b80c66297-11819477.pdf?src-supplier=RSComponents; ComponentLink2URL: https://datasheet.ciiva.com/7983/1018594-7983502.pdf?src-supplier=Element14; ComponentLink2Description: https://datasheet.ciiva.com/7983/1018594-7983502.pdf?src-supplier=Element14; ComponentLink3URL: https://datasheet.ciiva.com/22747/1018594-22747513.pdf?src-supplier=Element14; ComponentLink3Description: https://datasheet.ciiva.com/22747/1018594-22747513.pdf?src-supplier=Element14; ComponentLink4URL: https://datasheet.ciiva.com/12666/pyu-rc0402-51-rohs-l-6-r-12666741.pdf?src-supplier=Mouser; ComponentLink4Description: https://datasheet.ciiva.com/12666/pyu-rc0402-51-rohs-l-6-r-12666741.pdf?src-supplier=Mouser; ComponentLink5URL: https://datasheet.ciiva.com/7849/1018594-7849869.pdf?src-supplier=Element14; ComponentLink5Description: https://datasheet.ciiva.com/7849/1018594-7849869.pdf?src-supplier=Element14; ComponentLink6URL: https://datasheet.ciiva.com/7849/1018594-7849871.pdf?src-supplier=Element14; ComponentLink6Description: https://datasheet.ciiva.com/7849/1018594-7849871.pdf?src-supplier=Element14; ComponentLink7URL: https://datasheet.ciiva.com/17063/pyu-rc0402-51-rohs-l-6-r-17063193.pdf?src-supplier=Future+Electronics; ComponentLink7Description: https://datasheet.ciiva.com/17063/pyu-rc0402-51-rohs-l-6-r-17063193.pdf?src-supplier=Future+Electronics; Supplier Part Number 1: RC0402FR-071KL; LCSC Part Number: C106235

## Nets that join several sheets
1V8_SENSOR: Power-Sheet (C19.1 C20.2 P3.1 U3.5), Sensor-Sheet (J2.7), Level-Shifter-Sheet (FB5.1)
3V3_SENSOR: Power-Sheet (C12.1 FB3.2 P2.1), Sensor-Sheet (J2.8)
5V_TABLET: Power-Sheet (F2.2), Miscellaneous-Sheet (J5.5 J5.6 P18.1)
+3V3: Power-Sheet (C17.1 C18.1 P4.1 U2.3), Sensor-Sheet (6 pins), Output-Sheet (23 pins), U_Output-Sheet/Relay0 (K1_Relay0.1 K1_Relay0.10), U_Output-Sheet/Relay1 (K1_Relay1.1 K1_Relay1.10), U_Output-Sheet/Relay2 (K1_Relay2.1 K1_Relay2.10), U_Output-Sheet/Relay3 (K1_Relay3.1 K1_Relay3.10), U_Output-Sheet/Relay4 (K1_Relay4.1 K1_Relay4.10), U_Output-Sheet/Relay5 (K1_Relay5.1 K1_Relay5.10), U_Output-Sheet/Relay6 (K1_Relay6.1 K1_Relay6.10), Level-Shifter-Sheet (FB6.2), ESP32-Sheet (9 pins), Miscellaneous-Sheet (Q1.1 R24.2 R29.1 R31.1)
+5V: Power-Sheet (5 pins), Miscellaneous-Sheet (9 pins)
GND: Power-Sheet (29 pins), Sensor-Sheet (8 pins), Output-Sheet (20 pins), Level-Shifter-Sheet (C32.1 C33.2 U14.11), ESP32-Sheet (16 pins), Miscellaneous-Sheet (16 pins)
A1: Sensor-Sheet (J2.1), Level-Shifter-Sheet (U14.1)
A2: Sensor-Sheet (J2.2), Level-Shifter-Sheet (U14.3)
A3: Sensor-Sheet (J2.3), Level-Shifter-Sheet (U14.4)
A4: Sensor-Sheet (J2.4), Level-Shifter-Sheet (U14.5)
A5: Sensor-Sheet (J2.5), Level-Shifter-Sheet (U14.6)
A6: Sensor-Sheet (J2.6), Level-Shifter-Sheet (U14.7)
B: U_Output-Sheet/Relay3 (BR1_Relay3.4 K1_Relay3.3 K1_Relay3.8 RV1_Relay3.2), Output-Connection-Sheet (J7.1)
B1: Level-Shifter-Sheet (U14.20), ESP32-Sheet (P16.1 U15.31)
B2: Level-Shifter-Sheet (U14.18), ESP32-Sheet (P15.1 U15.30)
B3: Level-Shifter-Sheet (U14.17), ESP32-Sheet (P13.1 U15.28)
B4: Level-Shifter-Sheet (U14.16), ESP32-Sheet (P14.1 U15.29)
B5: Level-Shifter-Sheet (U14.15), ESP32-Sheet (U15.21)
B6: Level-Shifter-Sheet (U14.14), ESP32-Sheet (U15.22)
C: U_Output-Sheet/Relay0 (K1_Relay0.2 K1_Relay0.9), U_Output-Sheet/Relay1 (K1_Relay1.2 K1_Relay1.9), U_Output-Sheet/Relay2 (K1_Relay2.2 K1_Relay2.9), U_Output-Sheet/Relay3 (K1_Relay3.2 K1_Relay3.9), U_Output-Sheet/Relay4 (K1_Relay4.2 K1_Relay4.9), U_Output-Sheet/Relay5 (K1_Relay5.2 K1_Relay5.9), U_Output-Sheet/Relay6 (K1_Relay6.2 K1_Relay6.9), Output-Connection-Sheet (J7.5)
ESP_RXD: ESP32-Sheet (R19.2), Miscellaneous-Sheet (P25.1 Q5.3 R31.2)
ESP_TXD: ESP32-Sheet (R18.2), Miscellaneous-Sheet (P23.1 Q4.3 R29.2)
G: U_Output-Sheet/Relay1 (BR1_Relay1.4 K1_Relay1.3 K1_Relay1.8 RV1_Relay1.2), Output-Connection-Sheet (J6.2)
GPIO4: Output-Sheet (P8.1 R9.1 U6.4), ESP32-Sheet (U15.4)
GPIO5: Output-Sheet (P9.1 R8.1 U5.4), ESP32-Sheet (U15.5)
GPIO6: Output-Sheet (P10.1 R11.2), ESP32-Sheet (U15.6)
GPIO7: Output-Sheet (5 pins), ESP32-Sheet (U15.7)
GPIO8: Output-Sheet (5 pins), ESP32-Sheet (U15.12)
GPIO9: Output-Sheet (5 pins), ESP32-Sheet (U15.17)
GPIO11: ESP32-Sheet (U15.19), Miscellaneous-Sheet (Q2.1 R23.1)
GPIO12: ESP32-Sheet (U15.20), Miscellaneous-Sheet (Q3.1 R27.1)
GPIO16: ESP32-Sheet (U15.9), Miscellaneous-Sheet (P17.1 Q1.2 R24.1)
O: U_Output-Sheet/Relay4 (BR1_Relay4.4 K1_Relay4.3 K1_Relay4.8 RV1_Relay4.2), Output-Connection-Sheet (J7.2)
RC: U_Output-Sheet/Relay0 (BR1_Relay0.3 K1_Relay0.4 K1_Relay0.7 R12_Relay0.2), U_Output-Sheet/Relay1 (BR1_Relay1.3 K1_Relay1.4 K1_Relay1.7 R12_Relay1.2), U_Output-Sheet/Relay4 (BR1_Relay4.3 K1_Relay4.4 K1_Relay4.7 R12_Relay4.2), U_Output-Sheet/Relay6 (BR1_Relay6.3 K1_Relay6.4 K1_Relay6.7 R12_Relay6.2), Output-Connection-Sheet (J6.4)
RELAY_IN: U_Output-Sheet/Relay2 (BR1_Relay2.3 K1_Relay2.4 K1_Relay2.7 R12_Relay2.2), U_Output-Sheet/Relay3 (BR1_Relay3.3 K1_Relay3.4 K1_Relay3.7 R12_Relay3.2), U_Output-Sheet/Relay5 (BR1_Relay5.3 K1_Relay5.4 K1_Relay5.7 R12_Relay5.2), Output-Connection-Sheet (J6.5)
RELAY_O0: U_Output-Sheet/Relay0 (BR1_Relay0.4 K1_Relay0.3 K1_Relay0.8 RV1_Relay0.2), Output-Connection-Sheet (J6.1)
RELAY_O2: U_Output-Sheet/Relay2 (BR1_Relay2.4 K1_Relay2.3 K1_Relay2.8 RV1_Relay2.2), Output-Connection-Sheet (J6.3)
RELAY_O5: U_Output-Sheet/Relay5 (BR1_Relay5.4 K1_Relay5.3 K1_Relay5.8 RV1_Relay5.2), Output-Connection-Sheet (J7.3)
RELAY_O6: U_Output-Sheet/Relay6 (BR1_Relay6.4 K1_Relay6.3 K1_Relay6.8 RV1_Relay6.2), Output-Connection-Sheet (J7.4)
RELAY_RESET: Output-Sheet (U12.15), U_Output-Sheet/Relay4 (K1_Relay4.6)
RELAY_RESET: Output-Sheet (U12.13), U_Output-Sheet/Relay5 (K1_Relay5.6)
RELAY_RESET: Output-Sheet (U12.11), U_Output-Sheet/Relay6 (K1_Relay6.6)
RELAY_RESET: Output-Sheet (U11.16), U_Output-Sheet/Relay0 (K1_Relay0.6)
RELAY_RESET: Output-Sheet (U11.14), U_Output-Sheet/Relay1 (K1_Relay1.6)
RELAY_RESET: Output-Sheet (U11.12), U_Output-Sheet/Relay2 (K1_Relay2.6)
RELAY_RESET: Output-Sheet (U11.10), U_Output-Sheet/Relay3 (K1_Relay3.6)
RELAY_SET: Output-Sheet (U12.16), U_Output-Sheet/Relay3 (K1_Relay3.5)
RELAY_SET: Output-Sheet (U12.14), U_Output-Sheet/Relay4 (K1_Relay4.5)
RELAY_SET: Output-Sheet (U12.12), U_Output-Sheet/Relay5 (K1_Relay5.5)
RELAY_SET: Output-Sheet (U12.10), U_Output-Sheet/Relay6 (K1_Relay6.5)
RELAY_SET: Output-Sheet (U11.15), U_Output-Sheet/Relay0 (K1_Relay0.5)
RELAY_SET: Output-Sheet (U11.13), U_Output-Sheet/Relay1 (K1_Relay1.5)
RELAY_SET: Output-Sheet (U11.11), U_Output-Sheet/Relay2 (K1_Relay2.5)
RELAY_STS: Output-Sheet (R10.1 R11.1), U_Output-Sheet/Relay0 (U13_Relay0.4), U_Output-Sheet/Relay1 (U13_Relay1.4), U_Output-Sheet/Relay2 (U13_Relay2.4), U_Output-Sheet/Relay3 (U13_Relay3.4), U_Output-Sheet/Relay4 (U13_Relay4.4), U_Output-Sheet/Relay5 (U13_Relay5.4), U_Output-Sheet/Relay6 (U13_Relay6.4)
RELAY_STSN: Output-Sheet (U7.9), U_Output-Sheet/Relay6 (U13_Relay6.3)
RELAY_STSN: Output-Sheet (U7.10), U_Output-Sheet/Relay5 (U13_Relay5.3)
RELAY_STSN: Output-Sheet (U7.11), U_Output-Sheet/Relay4 (U13_Relay4.3)
RELAY_STSN: Output-Sheet (U7.12), U_Output-Sheet/Relay3 (U13_Relay3.3)
RELAY_STSN: Output-Sheet (U7.13), U_Output-Sheet/Relay2 (U13_Relay2.3)
RELAY_STSN: Output-Sheet (U7.14), U_Output-Sheet/Relay1 (U13_Relay1.3)
RELAY_STSN: Output-Sheet (U7.15), U_Output-Sheet/Relay0 (U13_Relay0.3)
SCL: Sensor-Sheet (U4.4), ESP32-Sheet (P11.1 R17.1 U15.39)
SDA: Sensor-Sheet (U4.3), ESP32-Sheet (P12.1 R16.1 U15.38)
USB_N: Power-Sheet (D1.4 J1.A7 J1.B7), ESP32-Sheet (U15.13)
USB_P: Power-Sheet (D1.3 J1.A6 J1.B6), ESP32-Sheet (U15.14)